# Altium schematic sheet power.SchDoc
size A2; SheetNumber: 2; SheetTotal: 6
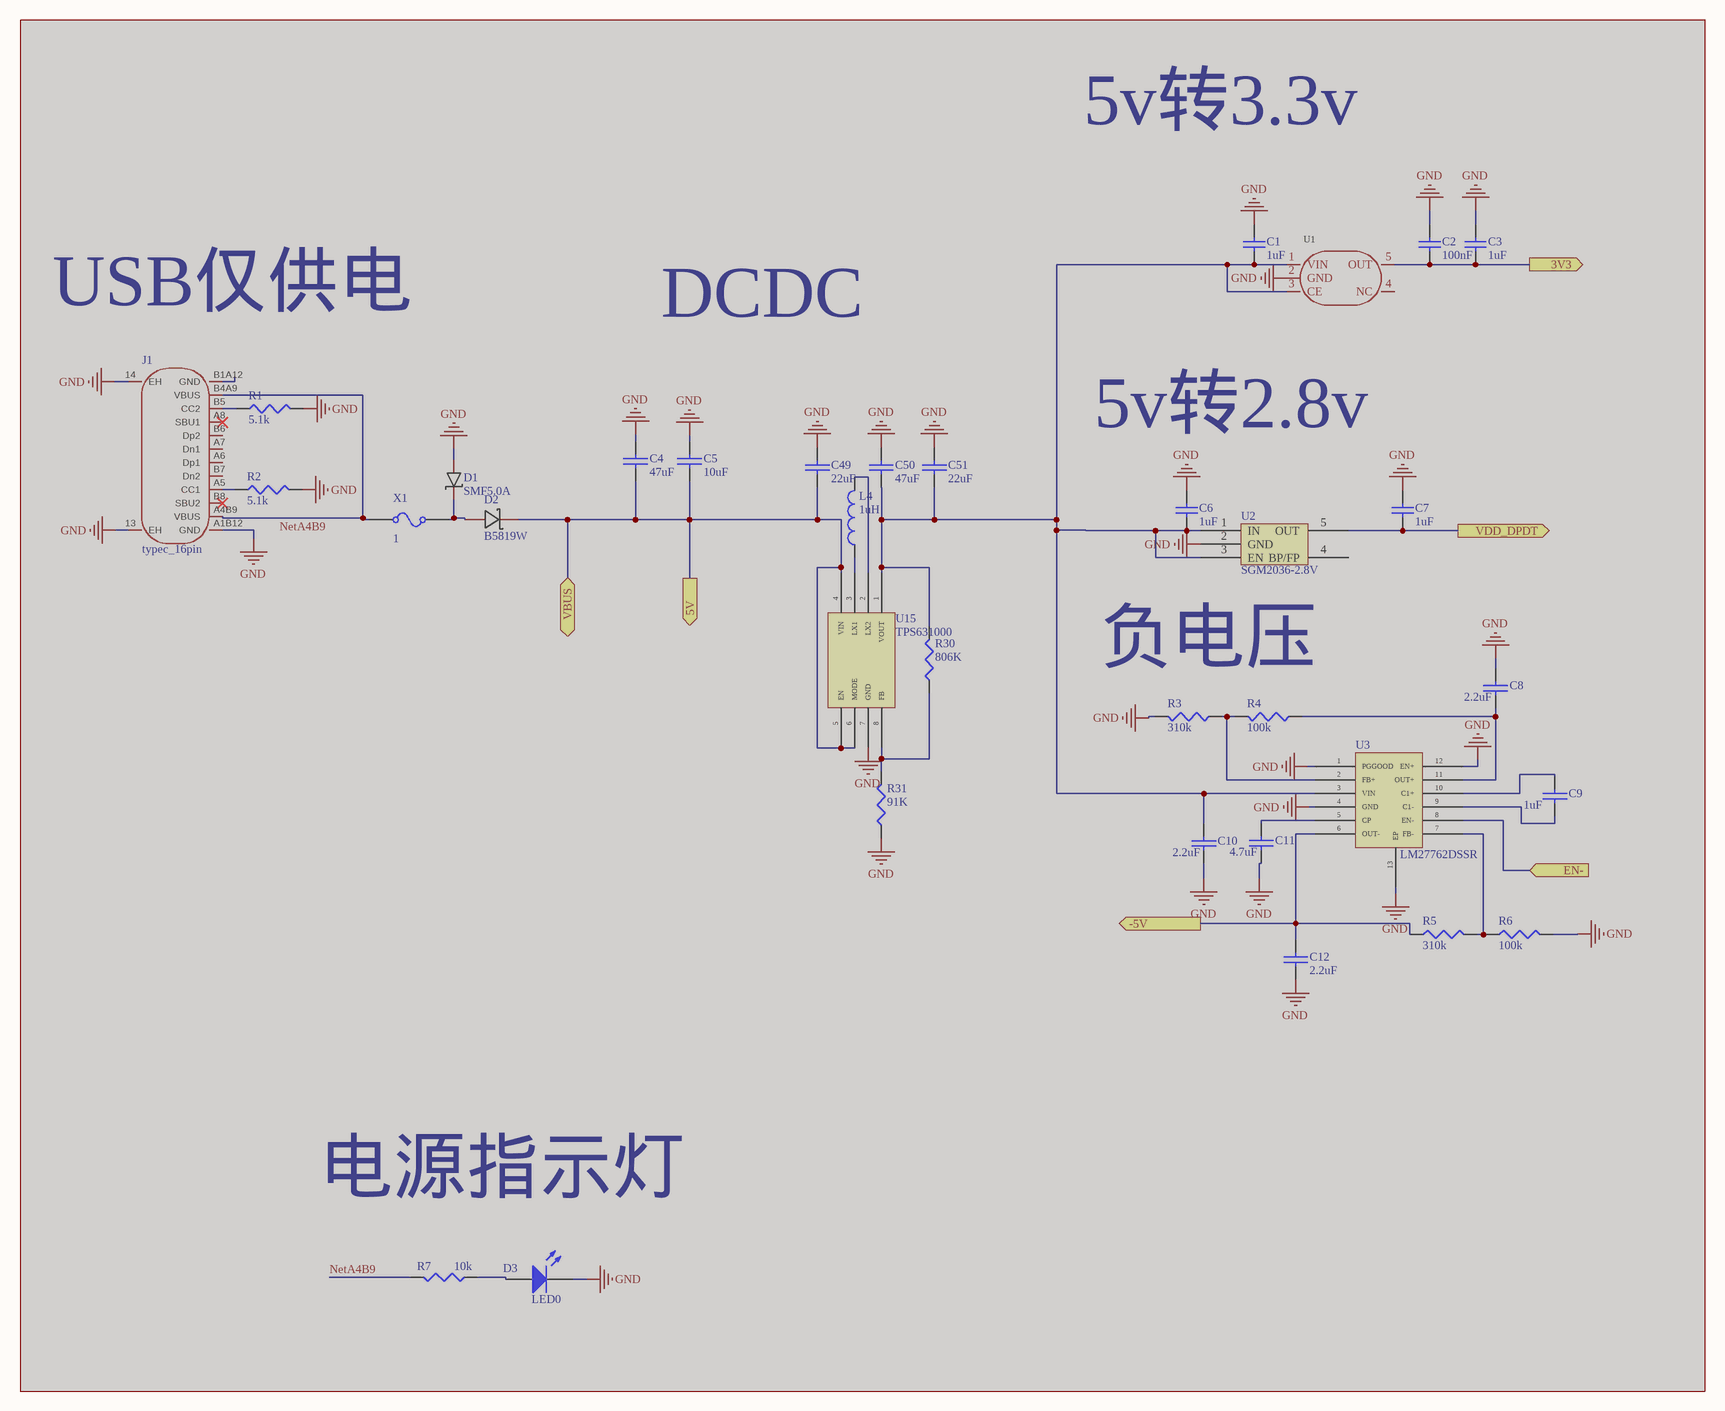
[diagram p0: power.SchDoc]

## Parts
C1  1uF  [0603_Z]  (masked out: inside a compile mask, not in the netlist)
C2  100nF  [0603_Z]  (masked out: inside a compile mask, not in the netlist)
C3  1uF  [0603_Z]  (masked out: inside a compile mask, not in the netlist)
C4  47uF  [0805]  (masked out: inside a compile mask, not in the netlist)
C5  10uF  [0603_Z]  (masked out: inside a compile mask, not in the netlist)
C6  1uF  [0603_Z]  (masked out: inside a compile mask, not in the netlist)
C7  1uF  [0603_Z]  (masked out: inside a compile mask, not in the netlist)
C8  2.2uF  [0402_Z]  (masked out: inside a compile mask, not in the netlist)
C9  1uF  [0402_Z]  (masked out: inside a compile mask, not in the netlist)
C10  2.2uF  [0402_Z]  (masked out: inside a compile mask, not in the netlist)
C11  4.7uF  [0603_Z]  (masked out: inside a compile mask, not in the netlist)
C12  2.2uF  [0402_Z]  (masked out: inside a compile mask, not in the netlist)
C49  22uF  [0402_Z]  (masked out: inside a compile mask, not in the netlist)
C50  47uF  [0402_Z]  (masked out: inside a compile mask, not in the netlist)
C51  22uF  [0402_Z]  (masked out: inside a compile mask, not in the netlist)
D1  SMF5.0A  [SMF5.0A]  (masked out: inside a compile mask, not in the netlist)
D2  B5819W  [BW5819W]  (masked out: inside a compile mask, not in the netlist)
D3  LED0  [0603_Z]  (masked out: inside a compile mask, not in the netlist)
J1  typec_16pin  [TYPEC_16PIN]  (masked out: inside a compile mask, not in the netlist)
L4  1uH  [0402_Z]  (masked out: inside a compile mask, not in the netlist)
R1  5.1k  [0402_Z]  (masked out: inside a compile mask, not in the netlist)
R2  5.1k  [0402_Z]  (masked out: inside a compile mask, not in the netlist)
R3  310k  [0402_Z]  (masked out: inside a compile mask, not in the netlist)
R4  100k  [0402_Z]  (masked out: inside a compile mask, not in the netlist)
R5  310k  [0402_Z]  (masked out: inside a compile mask, not in the netlist)
R6  100k  [0402_Z]  (masked out: inside a compile mask, not in the netlist)
R7  10k  [0402_Z]  (masked out: inside a compile mask, not in the netlist)
R30  806K  [0402_Z]  (masked out: inside a compile mask, not in the netlist)
R31  91K  [0402_Z]  (masked out: inside a compile mask, not in the netlist)
U1  SGM2036-3.3YN5G/TR  [SOT-23-5]  (value not drawn)  (masked out: inside a compile mask, not in the netlist)
U2  SGM2036-2.8V  [SOT-23-5]  (masked out: inside a compile mask, not in the netlist)
U3  LM27762DSSR  [LM27762]  (masked out: inside a compile mask, not in the netlist)
U15  TPS631000  [TPS631000DRLR]  (masked out: inside a compile mask, not in the netlist)
X1  CURRENT: 1  [F1206]  (hidden comment: Fuse)  (masked out: inside a compile mask, not in the netlist)

## Ports
3V3 (out), 5V (out), -5V (out), EN- (in), VBUS (bidir), VDD_DPDT (out)

## Notes on the sheet
- 5v转3.3v
- USB仅供电
- DCDC
- 5v转2.8v
- 负电压
- 电源指示灯

## Library data of the parts
C1-C3 C6 C7 = Cap: Capacitor; Value: 100pF; Published: 8-Jun-2000; LatestRevisionDate: 17-Jul-2002; LatestRevisionNote: Re-released for DXP Platform.; PackageReference: RAD-0.3; Publisher: Altium Limited; PackageDescription: Radial Cap, Thru-Hole; 2 Leads; 0.3 in Pin Spacing
C4 C5 C8-C12 C49-C51 = CAP: 0402; Value: 20pF  NP0
D2 = B5819W: 肖特基二极管
D3 = LED0: Typical INFRARED GaAs LED; Published: 8-Jun-2000; LatestRevisionDate: 08-Jul-2005; LatestRevisionNote: Mech Layer 1 removed.; PackageReference: LED-0; Publisher: Altium Limited; PackageDescription: LED; 2 Leads
L4 = Inductor_7: Inductor; Code_IEC: 1005; Code_JEITA: 0402; Published: 8-Jun-2000; LatestRevisionDate: 29-May-2009; LatestRevisionNote: IPC-7351 Footprint Added.; PackageReference: 0402-A; Publisher: Altium Limited; PackageDescription: Chip Inductor
R1-R7 R30 R31 = Res3: Resistor; Published: 8-Jun-2000; LatestRevisionDate: 04-Mar-2005; LatestRevisionNote: PCB Footprint replaced.; PackageReference: J1-0603; Publisher: Altium Limited
  R1 R2: Value: 5.1k
  R3 R5: Value: 310k
  R4 R6: Value: 100k
  R7: Value: 10k
  R30: Value: 806K
  R31: Value: 91K
U1 = LDO_ADJ_SGM2036: 0.8V-5V可调输出线性稳压器; Designer: U?; Symbol: SGM2036-3.3YN5G/TR; Device: SGM2036-3.3YN5G/TR
U2 = sgm2036
U15 = TPS631000: 可以兼容国产芯片
X1 = Fuse: RESISTANCE: 1m; SimulationGenericComponent: True